# Altium schematic sheet pwm_inverter.SchDoc
size A4; SheetNumber: 8; SheetTotal: 8
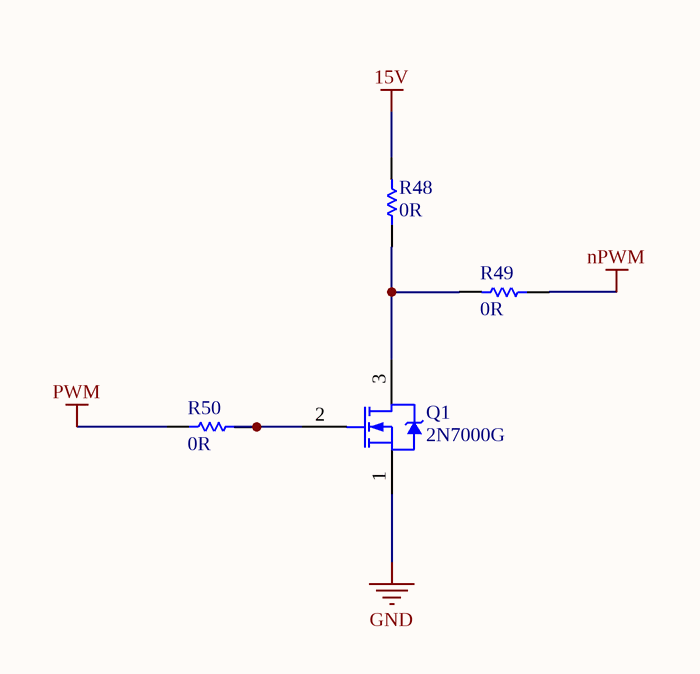
[diagram p0: pwm_inverter.SchDoc]

## Parts
Q1  2N7000G  [ONSC-TO-92-3-29-11]
R48  0R  [RESC1608L]
R49  0R  [RESC1608L]
R50  0R  [RESC1608L]

## Nets
15V: R48.2
GND: Q1.1(S)
nPWM: R49.1
PWM: R50.1
NetQ1_2: Q1.2(G) R50.2
NetQ1_3: Q1.3(D) R48.1 R49.2

## Library data of the parts
Q1 = CMP-1058-00937-1: Small Signal MOSFET, 200 mA, 60 V, N-Channel, 3-Pin TO-92, Pb-Free, Bulk Box; Manufacturer: On Semiconductor; Coss Typ (pF): 25; ID Max (A): 0.2; Ciss Typ (pF): 60; VGS(th) Max (V): 3; PD Max (W): 0.35; Configuration: Single; Channel Polarity: N Channel; VGS Max (V): 20; Crss Typ (pF): 5; RoHS: Pb-Free; PackageVersion: Rev. AM; Mounting Technology: Through Hole; PackageReference: TO-92-3-29-11_AM_SL; ComponentLink1Description: Manufacturer URL; PartNumber: 2N7000G; Package Type: TO-92; ComponentLink3Description: Package Specification; ComponentLink2Description: Datasheet; ComponentLink3URL: http://www.onsemi.cn/pub_link/Collateral/2N6426-D.PDF; DatasheetVersion: Rev. 8; Packing: Bulk Box; PackageDescription: 3-Pin Transistor Outline, Body 4.825 x 3.685 mm, Pitch 1.27 mm; ComponentLink1URL: http://www.onsemi.com/; V(BR)DSS Min (V): 60; ComponentLink2URL: http://www.onsemi.com/pub_link/Collateral/2N7000-D.PDF; Manufacturer 1: ON Semiconductor; Manufacturer Part Number 1: 2N7000G
R48-R50 = RS_0R0: RES 0.0 OHM 1/10W 5% 0603 SMD; Storage Location: PCB Assembly WS; Supplier: ECE Dept; Value: 0R